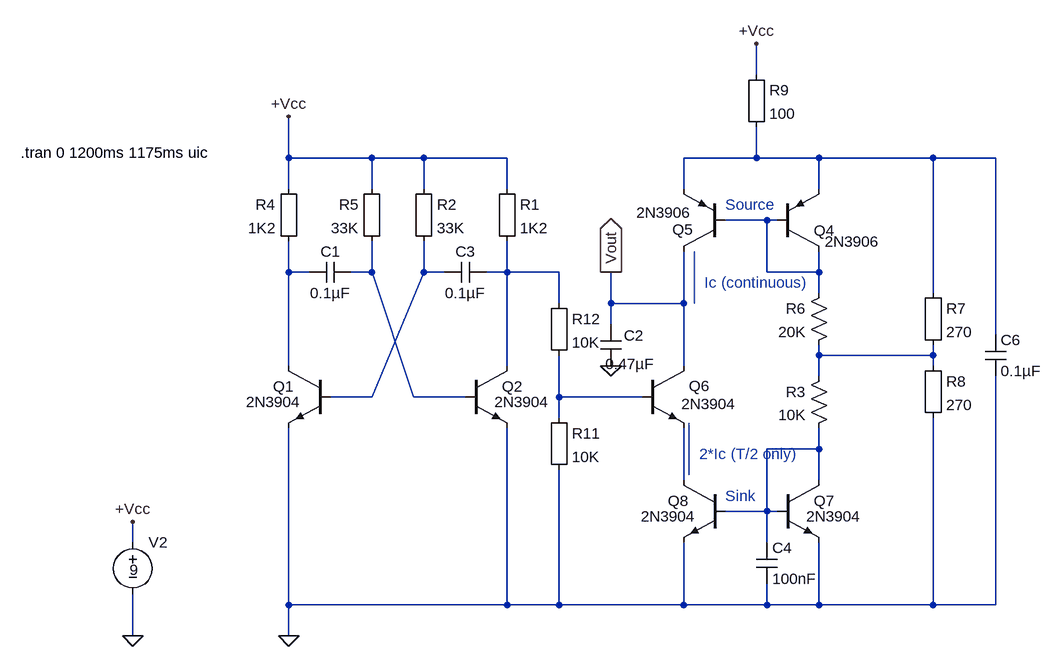
[diagram p0: schematic Triangle wave generator Agustín 07_mod.asc]
Triangle wave generator Agustín 07_mod.asc, the LTspice schematic file:
Version 4
SHEET 1 1860 1252
WIRE 80 -672 80 -720
WIRE -640 -544 -640 -608
WIRE -512 -544 -640 -544
WIRE -432 -544 -512 -544
WIRE -304 -544 -432 -544
WIRE 80 -544 80 -592
WIRE 80 -544 -32 -544
WIRE 176 -544 80 -544
WIRE 352 -544 176 -544
WIRE 448 -544 352 -544
WIRE -640 -496 -640 -544
WIRE -512 -496 -512 -544
WIRE -432 -496 -432 -544
WIRE -304 -496 -304 -544
WIRE -32 -496 -32 -544
WIRE 176 -496 176 -544
WIRE 96 -448 32 -448
WIRE 112 -448 96 -448
WIRE -640 -368 -640 -416
WIRE -608 -368 -640 -368
WIRE -512 -368 -512 -416
WIRE -512 -368 -544 -368
WIRE -432 -368 -432 -416
WIRE -400 -368 -432 -368
WIRE -304 -368 -304 -416
WIRE -304 -368 -336 -368
WIRE -224 -368 -304 -368
WIRE 96 -368 96 -448
WIRE 176 -368 176 -400
WIRE 176 -368 96 -368
WIRE 176 -336 176 -368
WIRE 352 -336 352 -544
WIRE -224 -320 -224 -368
WIRE -144 -320 -144 -368
WIRE -32 -320 -32 -400
WIRE -32 -320 -144 -320
WIRE -144 -288 -144 -320
WIRE 448 -272 448 -544
WIRE 176 -240 176 -256
WIRE 352 -240 352 -256
WIRE 352 -240 176 -240
WIRE -640 -224 -640 -368
WIRE -304 -224 -304 -368
WIRE -32 -224 -32 -320
WIRE 352 -224 352 -240
WIRE 176 -208 176 -240
WIRE -512 -176 -432 -368
WIRE -512 -176 -576 -176
WIRE -448 -176 -512 -368
WIRE -368 -176 -448 -176
WIRE -224 -176 -224 -240
WIRE -96 -176 -224 -176
WIRE -224 -144 -224 -176
WIRE 176 -96 176 -128
WIRE 176 -96 96 -96
WIRE -32 -48 -32 -128
WIRE 176 -48 176 -96
WIRE 96 0 96 -96
WIRE 96 0 32 0
WIRE 112 0 96 0
WIRE -880 48 -880 16
WIRE 96 48 96 0
WIRE -640 144 -640 -128
WIRE -304 144 -304 -128
WIRE -304 144 -640 144
WIRE -224 144 -224 -64
WIRE -224 144 -304 144
WIRE -32 144 -32 48
WIRE -32 144 -224 144
WIRE 96 144 96 112
WIRE 96 144 -32 144
WIRE 176 144 176 48
WIRE 176 144 96 144
WIRE 352 144 352 -144
WIRE 352 144 176 144
WIRE 448 144 448 -208
WIRE 448 144 352 144
WIRE -880 192 -880 128
WIRE -640 192 -640 144
FLAG -880 192 0
FLAG -880 16 +Vcc
FLAG -640 -608 +Vcc
FLAG -640 192 0
FLAG -144 -368 Vout
IOPIN -144 -368 Out
FLAG -144 -224 0
FLAG 80 -720 +Vcc
SYMBOL Misc\\EuropeanResistor -624 -512 M0
SYMATTR InstName R4
SYMATTR Value 1K2
SYMBOL Misc\\EuropeanResistor -496 -512 M0
SYMATTR InstName R5
SYMATTR Value 33K
SYMBOL cap -608 -352 R270
WINDOW 0 32 32 VTop 2
WINDOW 3 0 32 VBottom 2
SYMATTR InstName C1
SYMATTR Value 0.1µF
SYMBOL voltage -880 32 R0
WINDOW 123 0 0 Left 2
WINDOW 39 0 0 Left 2
WINDOW 3 -5 58 Left 2
SYMATTR Value 9
SYMATTR InstName V2
SYMBOL Misc\\EuropeanResistor -240 -160 R0
SYMATTR InstName R11
SYMATTR Value 10K
SYMBOL npn -96 -224 R0
WINDOW 0 72 31 Left 2
WINDOW 3 60 59 Left 2
SYMATTR InstName Q6
SYMATTR Value 2N3904
SYMBOL Misc\\EuropeanResistor -240 -336 R0
SYMATTR InstName R12
SYMATTR Value 10K
SYMBOL res 192 -224 M0
SYMATTR InstName R3
SYMATTR Value 10K
SYMBOL cap -128 -224 R180
WINDOW 0 -35 47 Left 2
WINDOW 3 -51 3 Left 2
SYMATTR InstName C2
SYMATTR Value 0.47µF
SYMBOL pnp 112 -400 M180
WINDOW 3 73 15 Left 2
SYMATTR Value 2N3906
SYMATTR InstName Q4
SYMBOL pnp 32 -400 R180
WINDOW 3 52 60 Left 2
WINDOW 0 49 34 Left 2
SYMATTR Value 2N3906
SYMATTR InstName Q5
SYMBOL res 192 -352 M0
SYMATTR InstName R6
SYMATTR Value 20K
SYMBOL npn 112 -48 R0
WINDOW 3 45 56 Left 2
SYMATTR Value 2N3904
SYMATTR InstName Q7
SYMBOL npn 32 -48 M0
WINDOW 3 45 56 Left 2
SYMATTR Value 2N3904
SYMATTR InstName Q8
SYMBOL Misc\\EuropeanResistor 336 -352 R0
SYMATTR InstName R7
SYMATTR Value 270
SYMBOL Misc\\EuropeanResistor 336 -240 R0
SYMATTR InstName R8
SYMATTR Value 270
SYMBOL Misc\\EuropeanResistor 64 -688 R0
SYMATTR InstName R9
SYMATTR Value 100
SYMBOL cap 432 -272 R0
SYMATTR InstName C6
SYMATTR Value 0.1µF
SYMBOL npn -576 -224 M0
WINDOW 3 45 56 Left 2
SYMATTR Value 2N3904
SYMATTR InstName Q1
SYMBOL npn -368 -224 R0
WINDOW 3 45 56 Left 2
SYMATTR Value 2N3904
SYMATTR InstName Q2
SYMBOL Misc\\EuropeanResistor -320 -512 R0
SYMATTR InstName R1
SYMATTR Value 1K2
SYMBOL Misc\\EuropeanResistor -448 -512 R0
SYMATTR InstName R2
SYMATTR Value 33K
SYMBOL cap -336 -352 M270
WINDOW 0 32 32 VTop 2
WINDOW 3 0 32 VBottom 2
SYMATTR InstName C3
SYMATTR Value 0.1µF
SYMBOL cap 80 48 R0
SYMATTR InstName C4
SYMATTR Value 100nF
TEXT -760 -552 Right 2 !.tran 0 1200ms 1175ms uic
TEXT 32 -472 Left 2 ;Source
TEXT 32 -24 Left 2 ;Sink
TEXT 0 -352 Left 2 ;Ic (continuous)
TEXT -8 -88 Left 2 ;2*Ic (T/2 only)
LINE Normal -16 -320 -16 -400
LINE Normal -24 -56 -24 -136

The netlist it stands for:
* Triangle wave generator Agustín 07_mod.asc
R4 +Vcc N003 1K2
R5 +Vcc N004 33K
C1 N003 N004 0.1µF
V2 +Vcc 0 9
R11 N008 0 10K
Q6 Vout N008 N010 0 2N3904
R12 N006 N008 10K
R3 N007 N009 10K
C2 0 Vout 0.47µF
Q4 N002 N002 N001 0 2N3906
Q5 Vout N002 N001 0 2N3906
R6 N002 N007 20K
Q7 N009 N009 0 0 2N3904
Q8 N010 N009 0 0 2N3904
R7 N001 N007 270
R8 N007 0 270
R9 +Vcc N001 100
C6 N001 0 0.1µF
Q1 N003 N005 0 0 2N3904
Q2 N006 N004 0 0 2N3904
R1 +Vcc N006 1K2
R2 +Vcc N005 33K
C3 N006 N005 0.1µF
C4 N009 0 100nF
.model NPN NPN
.model PNP PNP
.lib standard.bjt
.tran 0 1200ms 1175ms uic
* Source
* Sink
* Ic (continuous)
* 2*Ic (T/2 only)
.backanno
.end